# EAGLE design shell-id (EAGLE 8.1.1)
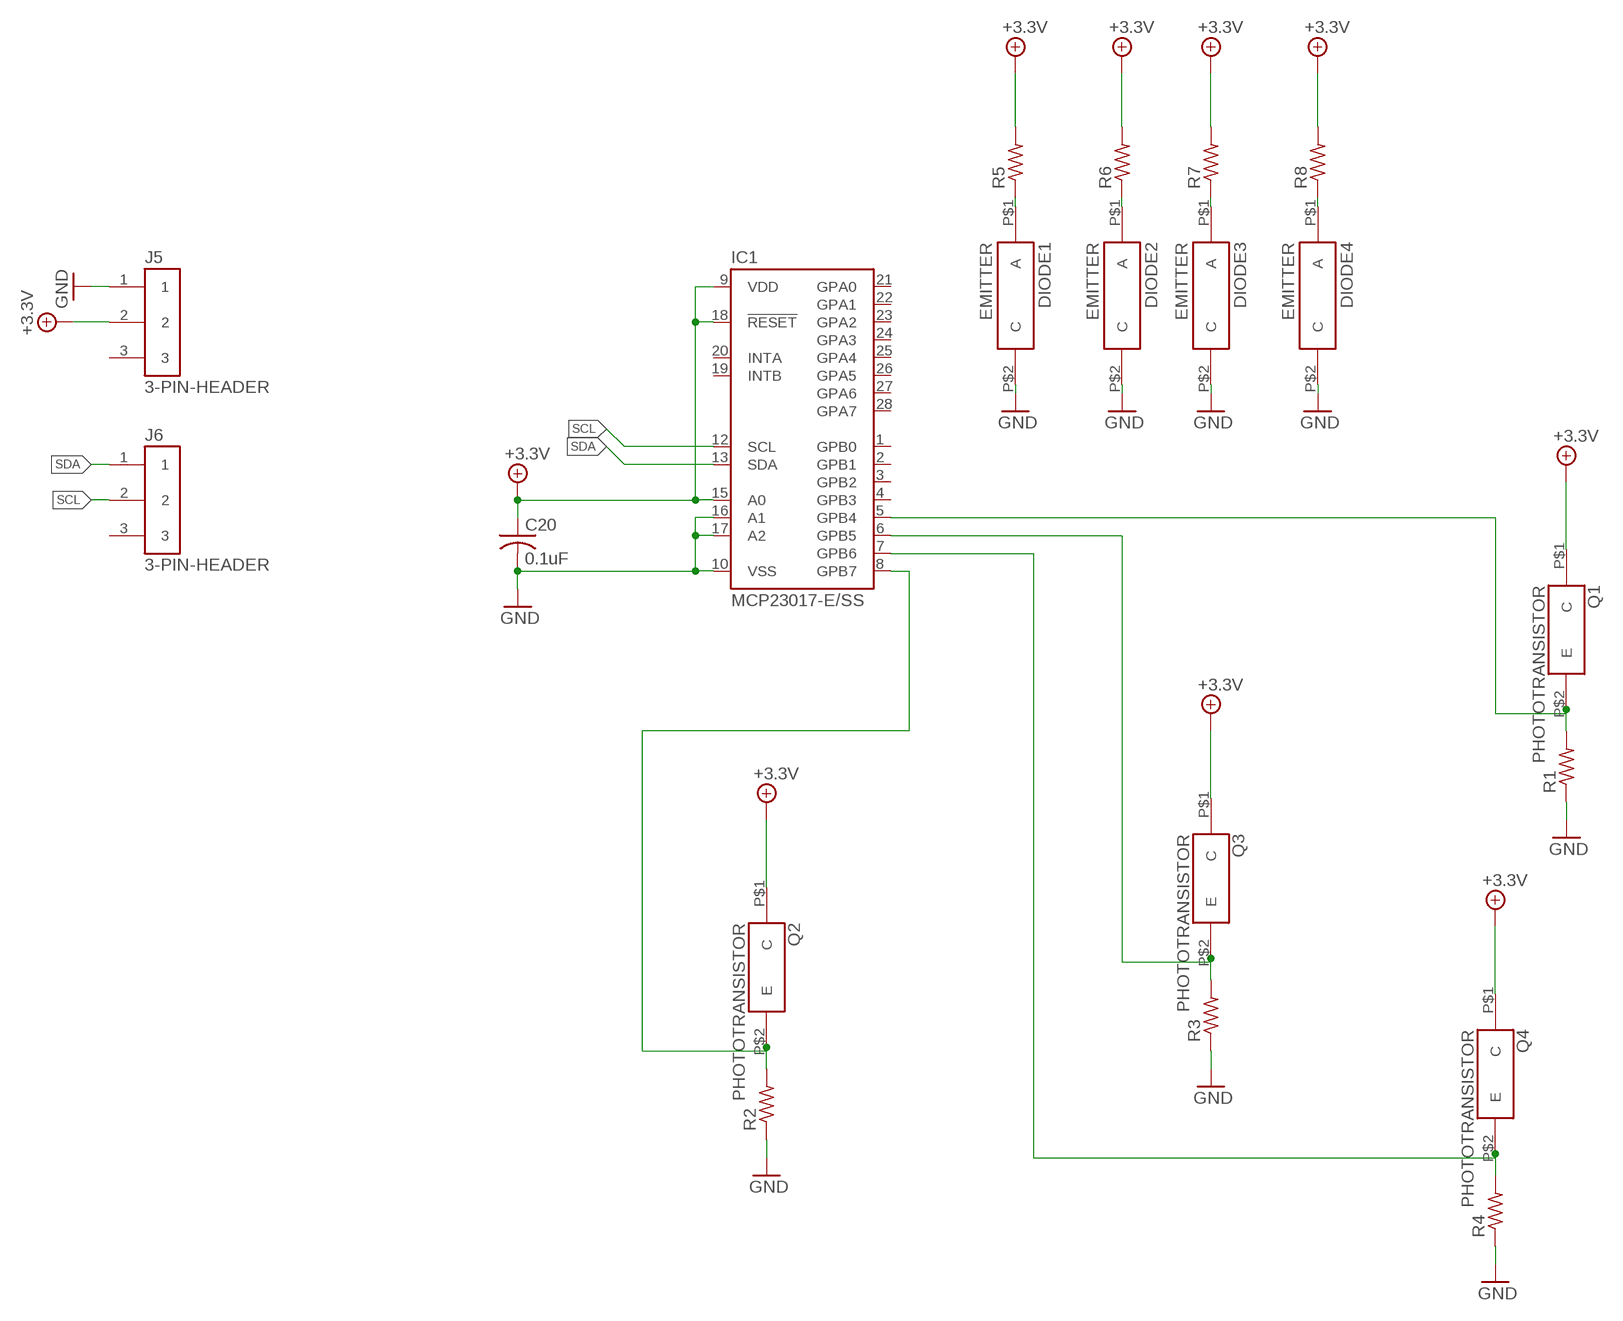
[diagram p0: schematic, sheet 1]

## Parts
C20  0.1uF  C-USC0603  [C0603]
DIODE1  EMITTER  [IR26-21C/L110/TR8]
DIODE2  EMITTER  [IR26-21C/L110/TR8]
DIODE3  EMITTER  [IR26-21C/L110/TR8]
DIODE4  EMITTER  [IR26-21C/L110/TR8]
IC1  MCP23017-E/SS  [SSOP-28]
J5  3-PIN-HEADER  [3-PIN-HEADER]
J6  3-PIN-HEADER  [3-PIN-HEADER]
Q1  PHOTOTRANSISTOR  [PT19-21C/L41/TR8]
Q2  PHOTOTRANSISTOR  [PT19-21C/L41/TR8]
Q3  PHOTOTRANSISTOR  [PT19-21C/L41/TR8]
Q4  PHOTOTRANSISTOR  [PT19-21C/L41/TR8]
R1  R-US_R0603  [R0603]
R2  R-US_R0603  [R0603]
R3  R-US_R0603  [R0603]
R4  R-US_R0603  [R0603]
R5  R-US_R0603  [R0603]
R6  R-US_R0603  [R0603]
R7  R-US_R0603  [R0603]
R8  R-US_R0603  [R0603]

## Nets
+3.3V: C20.1 IC1.9(VDD) IC1.18(!RESET) J5.2 Q1.P$1(C) Q2.P$1(C) Q3.P$1(C) Q4.P$1(C) R5.2 R6.2 R7.2 R8.2
GND: C20.2 DIODE1.P$2(C) DIODE2.P$2(C) DIODE3.P$2(C) DIODE4.P$2(C) IC1.10(VSS) IC1.16(A1) IC1.17(A2) J5.1 R1.1 R2.1 R3.1 R4.1
N$1: IC1.7(GPB6) Q4.P$2(E) R4.2
N$2: IC1.6(GPB5) Q3.P$2(E) R3.2
N$5: DIODE1.P$1(A) R5.1
N$6: DIODE2.P$1(A) R6.1
N$7: DIODE3.P$1(A) R7.1
N$8: DIODE4.P$1(A) R8.1
N$9: IC1.5(GPB4) Q1.P$2(E) R1.2
N$11: IC1.8(GPB7) Q2.P$2(E) R2.2
SCL: IC1.12(SCL) J6.2
SDA: IC1.13(SDA) J6.1
Unconnected: IC1.1(GPB0) IC1.2(GPB1) IC1.3(GPB2) IC1.4(GPB3) IC1.15(A0) IC1.19(INTB) IC1.20(INTA) IC1.21(GPA0) IC1.22(GPA1) IC1.23(GPA2) IC1.24(GPA3) IC1.25(GPA4) IC1.26(GPA5) IC1.27(GPA6) IC1.28(GPA7) J5.3 J6.3

## Library data of the parts
C20 = rcl:C-US: CAPACITOR, American symbol
DIODE1-DIODE4 = RoboJackets-LEDs:EMITTER
IC1 = RoboJackets-ICs:MCP23017: IO Expander 16bit I2C; DIGIKEY: MCP23017-E/SS-ND; MPN: MCP23017-E/SS
J5 J6 = RoboJackets-Connectors:3-PIN-HEADER; DIGIKEY: S7036-ND; MPN: PPPC031LFBN-RC
Q1 Q3 Q4 = RoboJackets-Discrete:PHOTOTRANSISTOR: Phototransistor
Q2 = electrical-engineering:PHOTOTRANSISTOR: Phototransistor
R1-R8 = rcl:R-US_: RESISTOR, American symbol

## Board
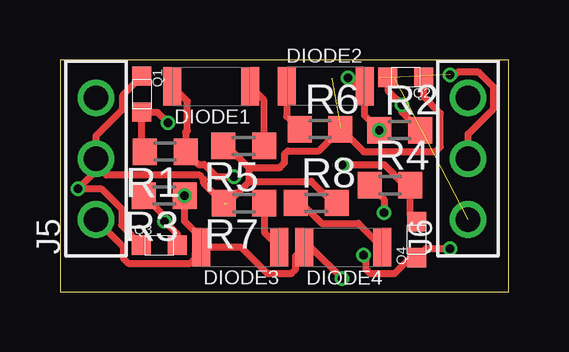
[diagram p1: board, top side]
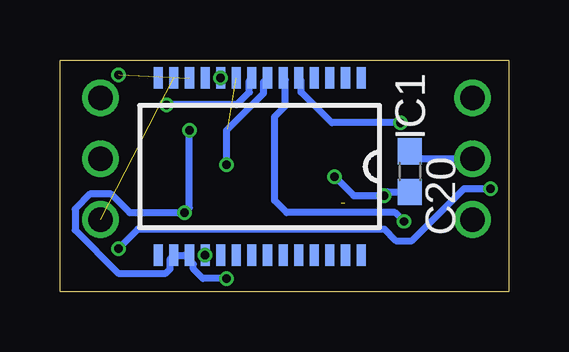
[diagram p2: board, bottom side, seen from below]

Size 18.69 x 9.67 mm. Coordinates in mm from the lower left corner, seen from the top.
Outline: 0,0 18.69,0 18.69,9.67 0,9.67 0,0
Copper layers (1*16): Top 0.018mm / dielectric 1.55mm / Bottom 0.018mm
Design rules "eC_2Layer_PClass6_BaseCopperO18_eCDefault": minimum track width 0.15mm, minimum drill 0.35mm, track to track 0.15mm, track to pad 0.15mm, pad to pad 0.15mm, via to via 0.15mm, smd to smd 0mil, copper to edge 0.25mm, drill to drill 0.35mm, minimum pad ring 0.175mm, minimum via ring 0.125mm, stop-mask expansion 0mil, vias tented up to drill 0.45mm, thermal gap 0.2mm

### Footprints (pad centres in the part's own frame; a part is rotated, then mirrored left to right if it is on the bottom)
C0603 = smd 1.1 x 1: 1 -0.85,0; 2 0.85,0
IR26-21C/L110/TR8 = smd 0.75 x 1.6: P$1 -1.6,0; P$2 1.65,0
SSOP-28 = smd 0.9 x 0.38: 1 -3.7,4.225; 2 -3.7,3.575; 3 -3.7,2.925; 4 -3.7,2.275; 5 -3.7,1.625; 6 -3.7,0.975; 7 -3.7,0.325; 8 -3.7,-0.325; 9 -3.7,-0.975; 10 -3.7,-1.625; 11 -3.7,-2.275; 12 -3.7,-2.925; 13 -3.7,-3.575; 14 -3.7,-4.225; 15 3.7,-4.225; 16 3.7,-3.575; 17 3.7,-2.925; 18 3.7,-2.275; 19 3.7,-1.625; 20 3.7,-0.975; 21 3.7,-0.325; 22 3.7,0.325; 23 3.7,0.975; 24 3.7,1.625; 25 3.7,2.275; 26 3.7,2.925; 27 3.7,3.575; 28 3.7,4.225
3-PIN-HEADER = drill 1.02: 1 -2.54,0; 2 0,0; 3 2.54,0
PT19-21C/L41/TR8 = smd 0.8 x 0.8: P$1 -0.75,0; P$2 0.75,0
R0603 = smd 1 x 1.1: 1 -0.85,0; 2 0.85,0

### Placement (x,y rotation side)
C20  4.11,5.01 270 bottom
DIODE1  6.33,8.57 180 top
DIODE2  11.04,8.57 0 top
DIODE3  7.54,1.86 180 top
DIODE4  11.83,1.85 180 top
IC1  10.37,5.22 270 bottom
J5  1.5,5.55 90 top
J6  17,5.55 90 top
Q1  3.41,8.24 270 top
Q2  14.41,8.94 180 top
Q3  4.14,1.94 0 top
Q4  14.87,2.17 90 top
R1  4.38,5.84 180 top
R2  14.15,6.74 0 top
R3  4.34,4.01 180 top
R4  13.75,4.44 0 top
R5  7.66,6.08 180 top
R6  10.83,6.78 0 top
R7  7.67,3.69 180 top
R8  10.68,3.7 0 top

### Tracks (layer width: path | path; a pad name or v marks a point on that pad's centre or on a via)
+3.3V  (via drill 0.35)  (2 unrouted)
  Top 0.3: Q1.P$1 2.62,8.2 2.62,7.63 1.5,6.51 J5.2 1.5,5.3 | 7.86,5.18 9.16,5.18 9.36,5.38 9.36,5.74 9.5,5.88 10.78,5.88 R6.2 11.71,6.78 12.65,5.84 15.65,5.84 15.85,6.04 15.85,7.44 15.16,8.13 Q2.P$1 | R5.2 6.96,6.08 7.86,5.18 | R8.2 11.38,3.7 10.48,4.6 7.88,4.6 | 6.97,3.69 7.88,4.6 | 1.5,5.3 1.5,5.05 v0.75,4.3 1.72,4.3 2.56,3.45 2.56,2.77 Q3.P$1 | v16.25,1.8 15.25,1.8 Q4.P$1 14.6,1.42 13.93,0.75 12.93,0.75 12.75,0.93 12.75,1.41 IC1.18 | R7.2 5.99,4.52 5.99,4.68 5.81,4.86 1.94,4.86 1.5,5.3 | 7.88,4.6 7.88,5.16 7.86,5.18
  Bottom 0.3: J5.2 3.8,5.55 C20.1 4.17,5.8 | v0.75,4.3 1.85,4.3 4.03,2.13 4.69,2.13 5.16,2.6 15.45,2.6 v16.25,1.8
  other vias: 12.64,1.52
GND  (via drill 0.35)
  Top 0.3: DIODE1.P$2 5.3,7.95 5.3,6.72 5.23,6.64 R1.1 5.76,5.31 6,5.31 6.51,4.8 v7.25,4.8 | J5.1 2.64,1.87 2.64,1.39 2.84,1.19 5.44,1.19 5.64,1.39 5.64,1.61 DIODE3.P$2 | DIODE3.P$2 5.64,2.11 5.64,2.49 5.19,2.94 R3.1 | R2.1 12.69,7.35 DIODE2.P$2 12.34,8.57 IC1.10 | DIODE3.P$2 7.54,1.86 8.64,0.76 9.64,0.76 9.82,0.94 9.82,1.48 DIODE4.P$2 10.45,1.85 v11.75,0.55 | R4.1 13.5,3.84 v13.5,3.3
  Bottom 0.3: 13.5,1.52 IC1.16 14.11,1.36 14.11,0.95 14.28,0.77 16.27,0.77 18.07,2.57 18.07,3.45 17.44,4.07 16.56,4.07 15.78,3.3 v13.5,3.3 13.3,3.5 R2.1 | 13.5,1.52 IC1.17 | 13.5,1.52 13.14,1.15 13.14,0.95 12.74,0.55 v11.75,0.55 | v7.25,4.8 6.46,4.01 R3.1 5.04,4.16 C20.2
  other vias: 12,8.92 13.3,6.74 5.19,4.01
N$1  (via drill 0.35)
  Top 0.3: Q4.P$2 14.6,3.19 R4.2 14.37,4.44 13.52,5.29 v11.76,5.29 v11.75,5.3
  Bottom 0.3: IC1.7 10.2,8.76 10.2,8.28 11.75,6.74 v11.75,5.3
N$2  (via drill 0.35)
  Top 0.3: Q3.P$2 4.89,2.4 v4.36,2.93 4.36,3.14 R3.2
  Bottom 0.3: IC1.6 9.3,8.83 9.3,7.75 9.75,7.3 9.75,3.8 9.25,3.3 4.73,3.3 v4.36,2.93
N$5
  Top 0.3: R5.1 8.51,7.99 DIODE1.P$1
N$6
  Top 0.3: DIODE2.P$1 9.44,7.32 R6.1
N$7
  Top 0.3: R7.1 8.52,2.48 DIODE3.P$1
N$8
  Top 0.3: R8.1 10.06,3.7 10.91,2.85 12.43,2.85 DIODE4.P$1
N$9  (via drill 0.35)
  Top 0.3: R1.2 3.41,5.96 Q1.P$2 4.06,7.49 v4.5,7.05
  Bottom 0.3: IC1.5 8.64,8.81 8.64,8.32 7.36,7.05 v4.5,7.05
N$11  (via drill 0.35)
  Top 0.3: Q2.P$2 13.66,8.39 v14.25,7.8 14.25,7.49 14.47,7.27 R2.2
  Bottom 0.3: IC1.8 10.8,8.81 10.8,8.32 11.33,7.8 v14.25,7.8
SCL  (via drill 0.35)  (1 unrouted)
  Top 0.3: J6.2 17,6.58 18.07,7.65 18.07,8.53 17.44,9.15 16.56,9.15 16.45,9.05 v16.25,9.05
SDA  (1 unrouted)